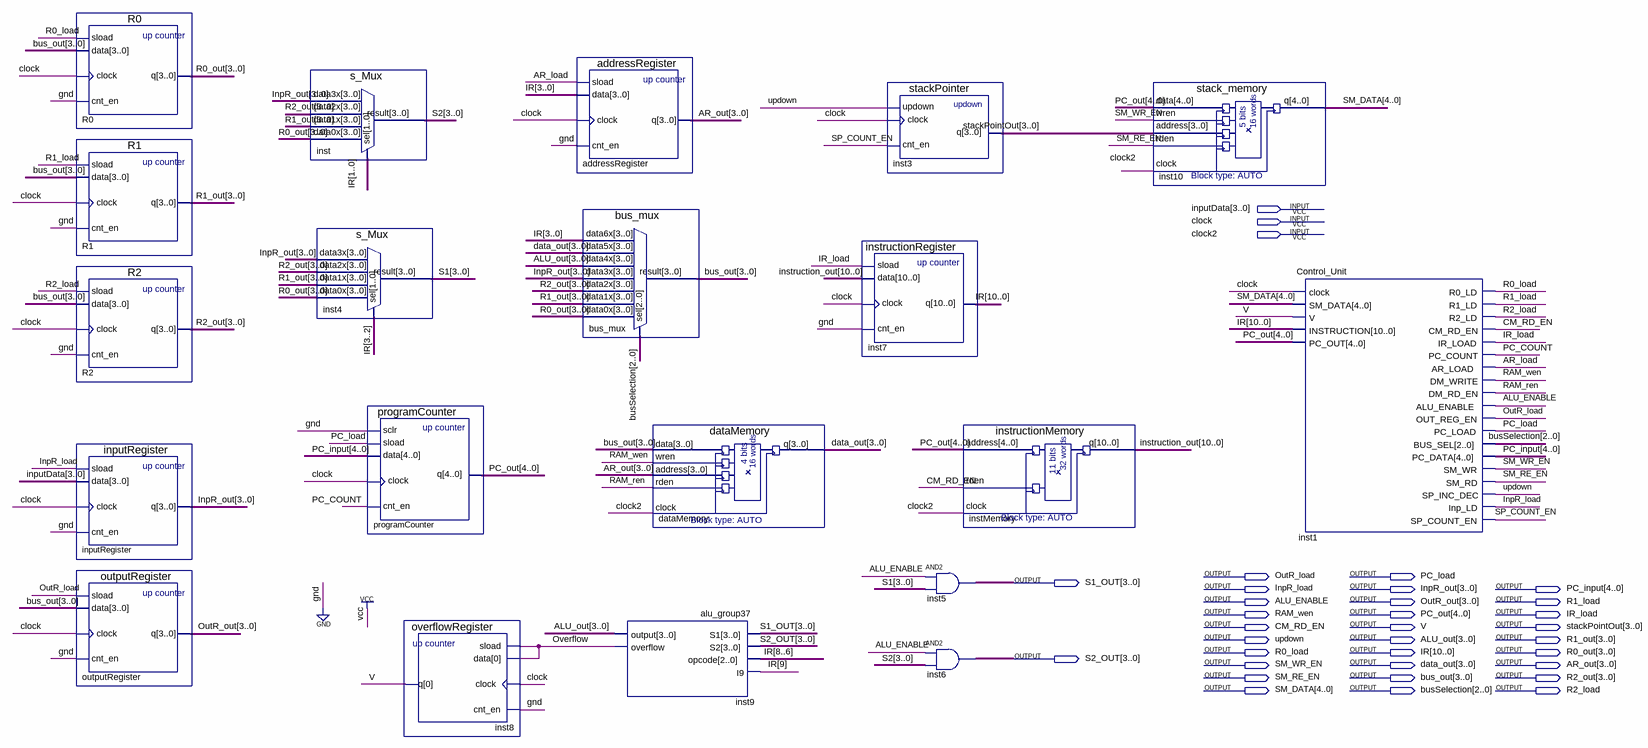
[diagram p0: schematic sheet]
// Quartus schematic DeuArc_2019510024_Anil_Can.bdf as structural Verilog: 20 symbols, 34 pins
module DeuArc_2019510024_Anil_Can (
  input  [3:0] inputData,
  input  clock,
  input  clock2,
  output OutR_load,
  output PC_load,
  output [3:0] S1_OUT,
  output InpR_load,
  output [3:0] InpR_out,
  output [4:0] PC_input,
  output ALU_ENABLE,
  output [3:0] OutR_out,
  output R1_load,
  output RAM_wen,
  output [4:0] PC_out,
  output IR_load,
  output CM_RD_EN,
  output V,
  output [3:0] stackPointOut,
  output updown,
  output [3:0] ALU_out,
  output [3:0] R1_out,
  output R0_load,
  output [10:0] IR,
  output [3:0] R0_out,
  output [3:0] S2_OUT,
  output SM_WR_EN,
  output [3:0] data_out,
  output [3:0] AR_out,
  output SM_RE_EN,
  output [3:0] bus_out,
  output [3:0] R2_out,
  output [4:0] SM_DATA,
  output [2:0] busSelection,
  output R2_load
);

  wire AR_load, Overflow, PC_COUNT, RAM_ren, SP_COUNT_EN;
  wire [3:0] S1, S2;
  wire [10:0] instruction_out;

  R0 R0 (.sload(R0_load), .data(bus_out), .clock(clock), .cnt_en(1'b0), .q(R0_out));
  R1 R1 (.sload(R1_load), .data(bus_out), .clock(clock), .cnt_en(1'b0), .q(R1_out));
  R2 R2 (.sload(R2_load), .data(bus_out), .clock(clock), .cnt_en(1'b0), .q(R2_out));
  inputRegister inputRegister (.sload(InpR_load), .data(inputData), .clock(clock), .cnt_en(1'b0), .q(InpR_out));
  outputRegister outputRegister (.sload(OutR_load), .data(bus_out), .clock(clock), .cnt_en(1'b0), .q(OutR_out));
  s_Mux inst (.data3x(InpR_out), .data2x(R2_out), .data1x(R1_out), .data0x(R0_out), .sel(IR[1:0]), .result(S2));
  s_Mux inst4 (.data3x(InpR_out), .data2x(R2_out), .data1x(R1_out), .data0x(R0_out), .sel(IR[3:2]), .result(S1));
  programCounter programCounter (
    .sclr(1'b0), .sload(PC_load), .data(PC_input), .clock(clock), .cnt_en(PC_COUNT), .q(PC_out));
  overflowRegister inst8 (.sload(Overflow), .data(Overflow), .clock(clock), .cnt_en(1'b0), .q(V));
  addressRegister addressRegister (.sload(AR_load), .data(IR[3:0]), .clock(clock), .cnt_en(1'b0), .q(AR_out));
  bus_mux bus_mux (
    .data6x(IR[3:0]), .data5x(data_out), .data4x(ALU_out), .data3x(InpR_out), .data2x(R2_out),
    .data1x(R1_out), .data0x(R0_out), .sel(busSelection), .result(bus_out));
  alu_group37 inst9 (.S1(S1_OUT), .S2(S2_OUT), .opcode(IR[8:6]), .I9(IR[9]), .\output (ALU_out), .overflow(Overflow));
  dataMemory dataMemory (
    .data(bus_out), .wren(RAM_wen), .address(AR_out), .rden(RAM_ren), .clock(clock2), .q(data_out));
  stackPointer inst3 (.updown(updown), .clock(clock), .cnt_en(SP_COUNT_EN), .q(stackPointOut));
  instructionRegister inst7 (.sload(IR_load), .data(instruction_out), .clock(clock), .cnt_en(1'b0), .q(IR));
  assign S1_OUT = {4{ALU_ENABLE}} & S1;  // AND2 inst5, 4 bits wide
  assign S2_OUT = {4{ALU_ENABLE}} & S2;  // AND2 inst6, 4 bits wide
  instructionMemory instMemory (.address(PC_out), .rden(CM_RD_EN), .clock(clock2), .q(instruction_out));
  stack_memory inst10 (
    .data(PC_out), .wren(SM_WR_EN), .address(stackPointOut), .rden(SM_RE_EN), .clock(clock2), .q(SM_DATA));
  Control_Unit inst1 (
    .clock(clock), .SM_DATA(SM_DATA), .V(V), .INSTRUCTION(IR), .PC_OUT(PC_out), .R0_LD(R0_load),
    .R1_LD(R1_load), .R2_LD(R2_load), .CM_RD_EN(CM_RD_EN), .IR_LOAD(IR_load), .PC_COUNT(PC_COUNT),
    .AR_LOAD(AR_load), .DM_WRITE(RAM_wen), .DM_RD_EN(RAM_ren), .ALU_ENABLE(ALU_ENABLE),
    .OUT_REG_EN(OutR_load), .PC_LOAD(PC_load), .BUS_SEL(busSelection), .PC_DATA(PC_input), .SM_WR(SM_WR_EN),
    .SM_RD(SM_RE_EN), .SP_INC_DEC(updown), .Inp_LD(InpR_load), .SP_COUNT_EN(SP_COUNT_EN));
endmodule
